# Altium schematic sheet Sheet1.SchDoc: Team Ether
size A2; SheetNumber: 1; SheetTotal: 1
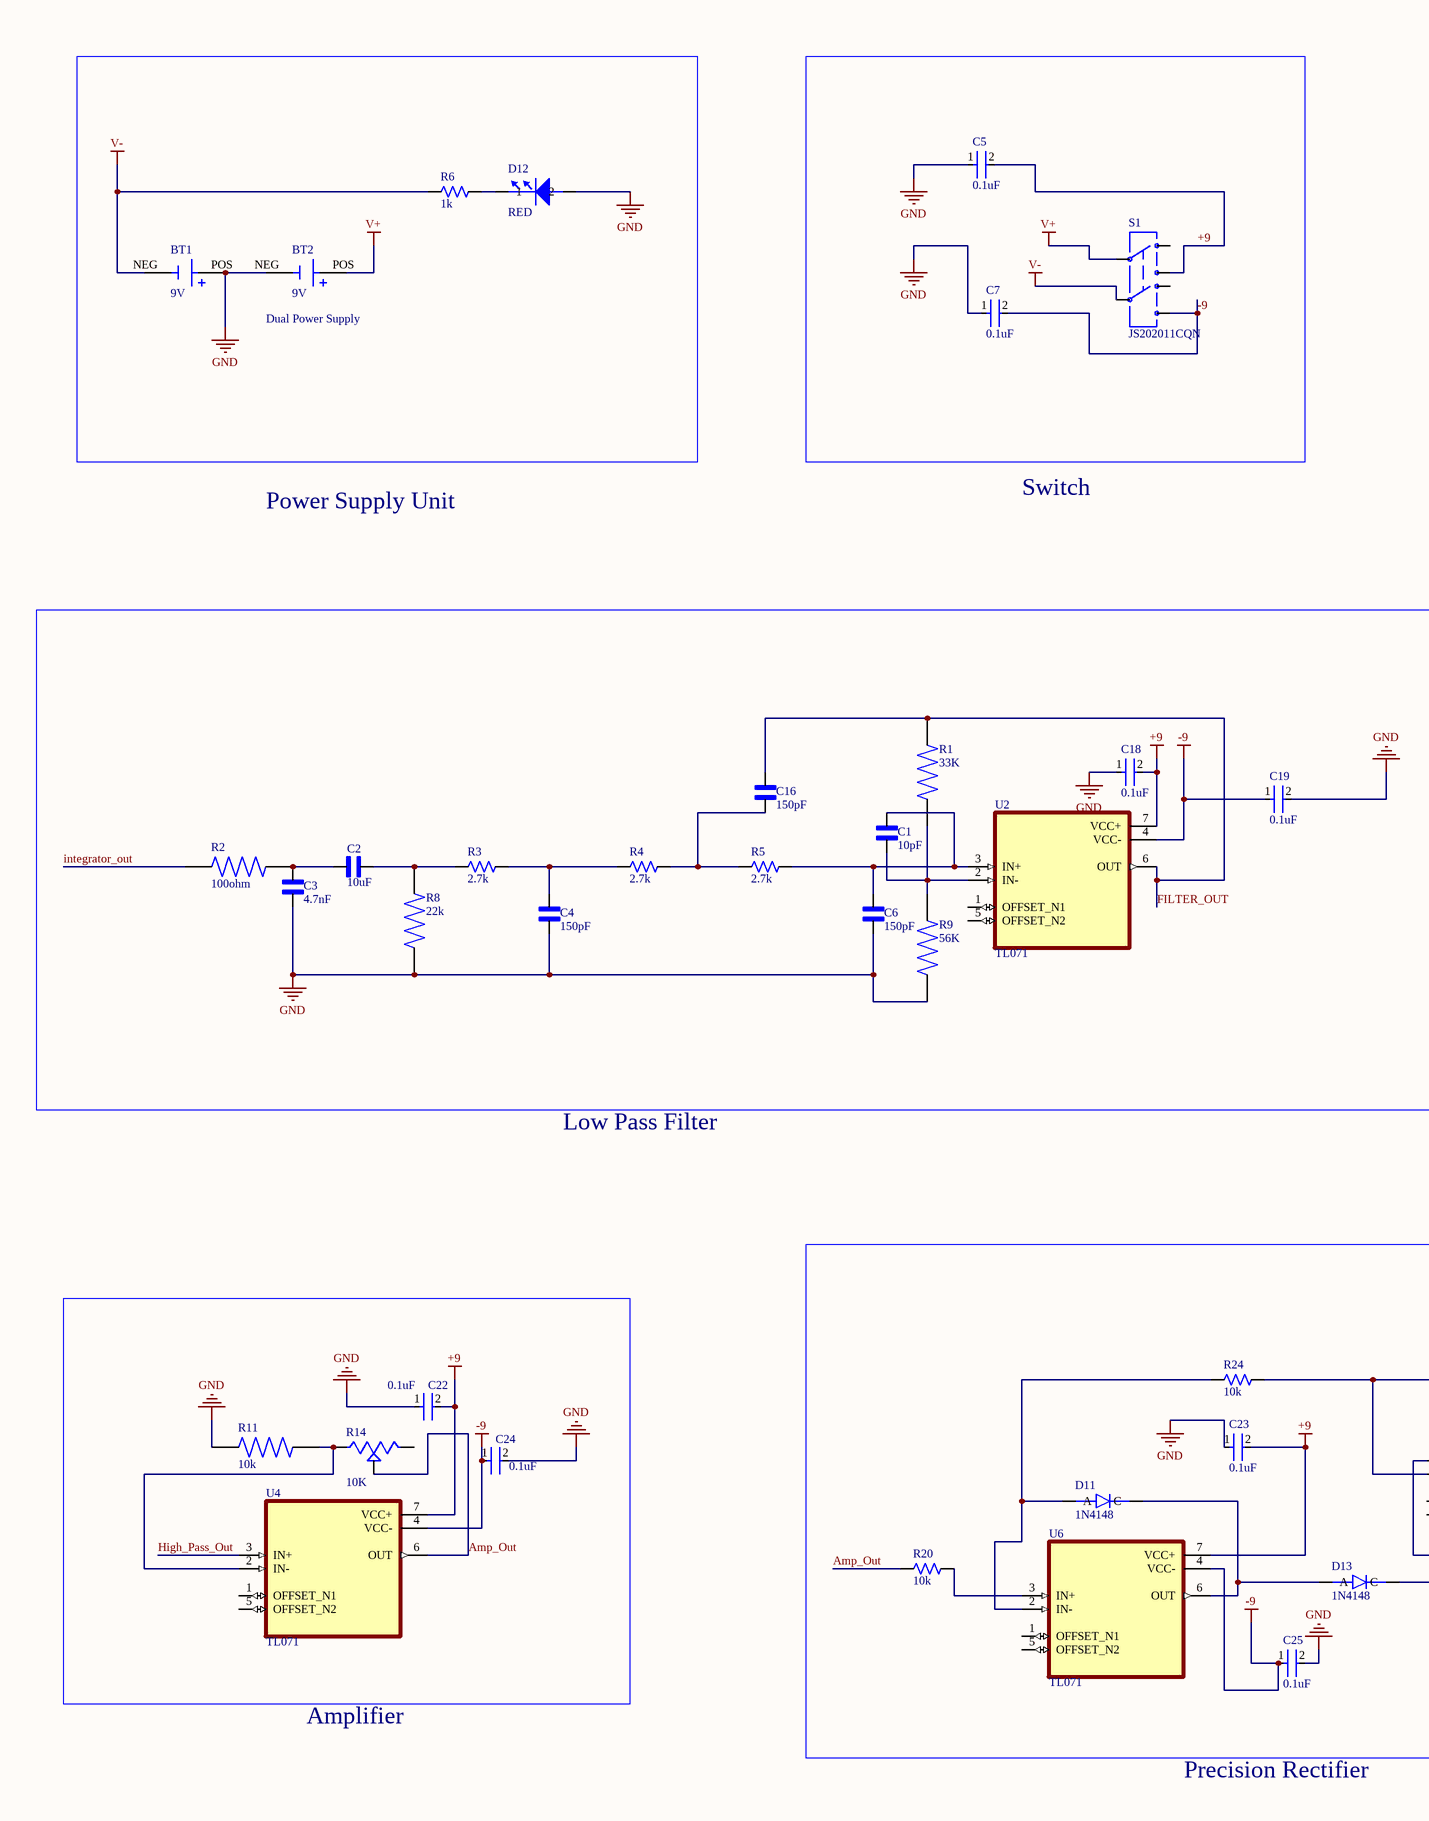
[diagram p0: Sheet1.SchDoc, left]
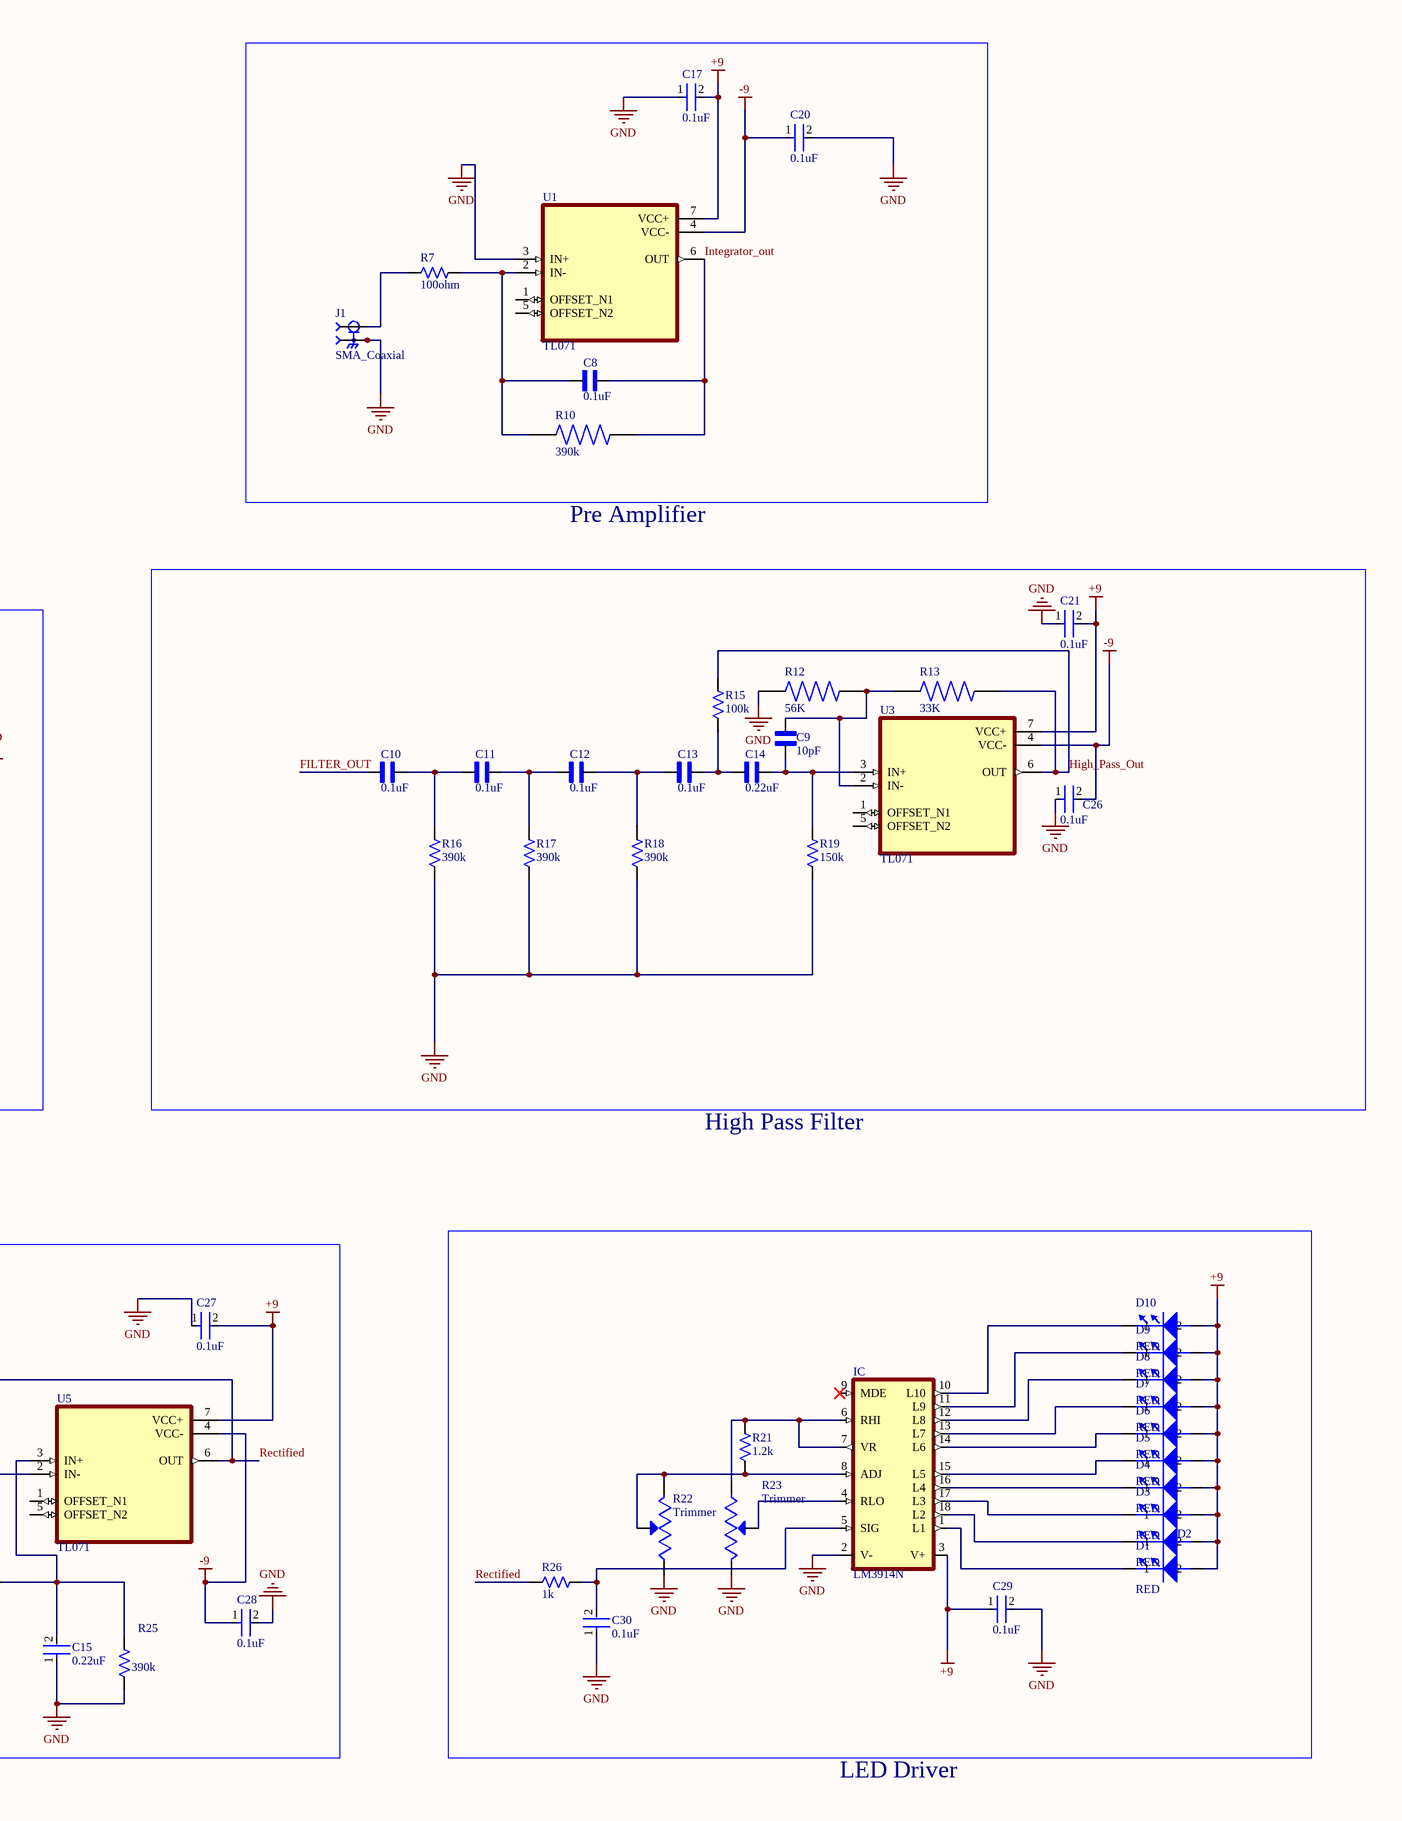
[diagram p1: Sheet1.SchDoc, right]

## Parts
BT1  9V  [BAT_BH9VW]
BT2  9V  [BAT_BH9VW]
C1  10pF  [CAPC1608X90N]
C2  10uF  [CAPC1608X90N]
C3  4.7nF  [CAPC1608X90N]
C4  150pF  [CAPC1608X90N]
C5  0.1uF  [FP-RDE2M1-MFG]
C6  150pF  [CAPC1608X90N]
C7  0.1uF  [FP-RDE2M1-MFG]
C8  0.1uF  [CAPC1005X55N]
C9  10pF  [CAPC1608X90N]
C10  0.1uF  [CAPC1005X55N]
C11  0.1uF  [CAPC1005X55N]
C12  0.1uF  [CAPC1005X55N]
C13  0.1uF  [CAPC1005X55N]
C14  0.22uF  [CAPC2012X135N]
C15  0.22uF  [FP-RDE2M1-MFG]
C16  150pF  [CAPC1608X90N]
C17  0.1uF  [FP-RDE2M1-MFG]
C18  0.1uF  [FP-RDE2M1-MFG]
C19  0.1uF  [FP-RDE2M1-MFG]
C20  0.1uF  [FP-RDE2M1-MFG]
C21  0.1uF  [FP-RDE2M1-MFG]
C22  0.1uF  [FP-RDE2M1-MFG]
C23  0.1uF  [FP-RDE2M1-MFG]
C24  0.1uF  [FP-RDE2M1-MFG]
C25  0.1uF  [FP-RDE2M1-MFG]
C26  0.1uF  [FP-RDE2M1-MFG]
C27  0.1uF  [FP-RDE2M1-MFG]
C28  0.1uF  [FP-RDE2M1-MFG]
C29  0.1uF  [FP-RDE2M1-MFG]
C30  0.1uF  [FP-RDE2M1-MFG]
D1  RED  [WL-TMRC_5MM]
D2  RED  [WL-TMRC_5MM]
D3  RED  [WL-TMRC_5MM]
D4  RED  [WL-TMRC_5MM]
D5  RED  [WL-TMRC_5MM]
D6  RED  [WL-TMRC_5MM]
D7  RED  [WL-TMRC_5MM]
D8  RED  [WL-TMRC_5MM]
D9  RED  [WL-TMRC_5MM]
D10  RED  [WL-TMRC_5MM]
D11  1N4148  [SOD2513X120N]
D12  RED  [WL-TMRC_5MM]
D13  1N4148  [SOD2513X120N]
IC  LM3914N  [DIL18]
J1  SMA_Coaxial  [SAMTEC_SMA-J-P-H-ST-EM1]
R1  33K  [RESC1608X55N]
R2  100ohm  [RESC2012X65N]
R3  2.7k  [BigRes]
R4  2.7k  [BigRes]
R5  2.7k  [BigRes]
R6  1k  [BigRes]
R7  100ohm  [BigRes]
R8  22k  [RESC2012X65N]
R9  56K  [RESC1608X55N]
R10  390k  [RESC2012X65N]
R11  10k  [RESC2012X65N]
R12  56K  [RESC1608X55N]
R13  33K  [RESC1608X55N]
R14  10K  [POT_PTN16-A05120K1B1]
R15  100k  [BigRes]
R16  390k  [BigRes]
R17  390k  [BigRes]
R18  390k  [BigRes]
R19  150k  [BigRes]
R20  10k  [BigRes]
R21  1.2k  [BigRes]
R22  Trimmer  [TRIM_3296W-1-505LF]
R23  Trimmer  [TRIM_3296W-1-505LF]
R24  10k  [BigRes]
R25  390k  [BigRes]
R26  1k  [BigRes]
S1  JS202011CQN  [SPARKFUN-RETIRED_SWITCH-2.5X3.2-6]
U1  TL071  [DIP794W45P254L959H508Q8]
U2  TL071  [DIP794W45P254L959H508Q8]
U3  TL071  [DIP794W45P254L959H508Q8]
U4  TL071  [DIP794W45P254L959H508Q8]
U5  TL071  [DIP794W45P254L959H508Q8]
U6  TL071  [DIP794W45P254L959H508Q8]

## Blocks framed on the sheet
Dual Power Supply: BT1 BT2 D12 R6

## Nets
+9: C5.2 C17.2 C18.2 C21.2 C22.2 C23.2 C27.2 C29.1 D1.2 D2.2 D3.2 D4.2 D5.2 D6.2 D7.2 D8.2 D9.2 D10.2 IC.3(V+) S1.3 U1.7(VCC+) U2.7(VCC+) U3.7(VCC+) U4.7(VCC+) U5.7(VCC+) U6.7(VCC+)
-9: C7.2 C19.1 C20.1 C24.1 C25.1 C26.2 C28.1 S1.6 U1.4(VCC-) U2.4(VCC-) U3.4(VCC-) U4.4(VCC-) U5.4(VCC-) U6.4(VCC-)
GND: BT1.POS BT2.NEG C3.1 C4.1 C5.1 C6.1 C7.1 C15.1 C17.1 C18.1 C19.2 C20.2 C21.1 C22.1 C23.1 C24.2 C25.2 C26.1 C27.1 C28.2 C29.2 C30.1 D12.2 IC.2(V-) J1.2_1 J1.2_2 J1.3_1 J1.3_2 R8.1 R9.1 R11.1 R12.2 R16.1 R17.1 R18.1 R19.1 R22.1(CCW) R23.3(CW) R25.1 U1.3(IN+)
V+: BT2.POS S1.2
V-: BT1.NEG R6.1 S1.5
Amp_Out: R14.2 R20.2 U4.6(OUT)
FILTER_OUT: C10.1 C16.2 R1.2 U2.6(OUT)
High_Pass_Out: R13.1 R15.2 U3.6(OUT) U4.3(IN+)
Integrator_out: C8.2 R2.1 R10.2 U1.6(OUT)
Rectified: R24.1 R26.2 U5.2(IN-) U5.6(OUT)
NetC1_1: C1.1 R1.1 R9.2 U2.2(IN-)
NetC1_2: C1.2 C6.2 R5.2 U2.3(IN+)
NetC2_1: C2.1 C3.2 R2.2
NetC2_2: C2.2 R3.1 R8.2
NetC4_2: C4.2 R3.2 R4.1
NetC8_1: C8.1 R7.2 R10.1 U1.2(IN-)
NetC9_1: C9.1 C14.2 R19.2 U3.3(IN+)
NetC9_2: C9.2 R12.1 R13.2 U3.2(IN-)
NetC10_2: C10.2 C11.1 R16.2
NetC11_2: C11.2 C12.1 R17.2
NetC12_2: C12.2 C13.1 R18.2
NetC13_2: C13.2 C14.1 R15.1
NetC15_2: C15.2 D13.C R25.2 U5.3(IN+)
NetC16_1: C16.1 R4.2 R5.1
NetC30_2: C30.2 IC.5(SIG) R26.1
NetD1_1: D1.1 IC.1(L1)
NetD2_1: D2.1 IC.18(L2)
NetD3_1: D3.1 IC.17(L3)
NetD4_1: D4.1 IC.16(L4)
NetD5_1: D5.1 IC.15(L5)
NetD6_1: D6.1 IC.14(L6)
NetD7_1: D7.1 IC.13(L7)
NetD8_1: D8.1 IC.12(L8)
NetD9_1: D9.1 IC.11(L9)
NetD10_1: D10.1 IC.10(L10)
NetD11_A: D11.A R24.2 U6.2(IN-)
NetD11_C: D11.C D13.A U6.6(OUT)
NetD12_1: D12.1 R6.2
NetIC_4: IC.4(RLO) R23.2(WIPER)
NetIC_6: IC.6(RHI) IC.7(VR) R21.2 R23.1(CCW)
NetIC_8: IC.8(ADJ) R21.1 R22.2(WIPER) R22.3(CW)
NetJ1_1: J1.1 R7.1
NetR11_2: R11.2 R14.1 U4.2(IN-)
NetR20_1: R20.1 U6.3(IN+)

Not connected (* = marked no-connect by the designer): IC 9(MDE)*; R14 3; S1 1 4; U1 1(OFFSET_N1) 5(OFFSET_N2); U2 1(OFFSET_N1) 5(OFFSET_N2); U3 1(OFFSET_N1) 5(OFFSET_N2); U4 1(OFFSET_N1) 5(OFFSET_N2); U5 1(OFFSET_N1) 5(OFFSET_N2); U6 1(OFFSET_N1) 5(OFFSET_N2)

## Notes on the sheet
- Power Supply Unit
- Switch
- Pre Amplifier
- Low Pass Filter
- High Pass Filter
- Amplifier
- Precision Rectifier
- LED Driver

## Library data of the parts
BT1 BT2 = BH9VW: Battery Holder _Open_ 9V 1 Cell Wire Leads - 6 _152.4mm_; MF: MPD; Value: *; Package: None; MP: BH9VW; Price: None; SnapEDA_Link: https://www.snapeda.com/parts/BH9VW/MPD/view-part/4480509/?ref=snap; Availability: Unavailable
C1 C9 = CL10C100JB8NNNC: 10 pF Â±5% 50V Ceramic Capacitor C0G, NP0 0603 (1608 Metric); MF: Samsung; SnapEDA_Link: https://www.snapeda.com/parts/CL10C100JB8NNNC/Samsung/view-part/?ref=snap; Package: SMD-2 Samsung; Value: *; MP: CL10C100JB8NNNC; Check_prices: https://www.snapeda.com/parts/CL10C100JB8NNNC/Samsung/view-part/?ref=eda
C2 = CL10A106MQ8NNNC: 10 ÂµF Â±20% 6.3V Ceramic Capacitor X5R 0603 (1608 Metric); MF: Samsung Electro-Mechanics; SnapEDA_Link: https://www.snapeda.com/parts/CL10A106MQ8NNNC/Samsung/view-part/?ref=snap; Package: SMD-2 Samsung; Value: *; MP: CL10A106MQ8NNNC; Check_prices: https://www.snapeda.com/parts/CL10A106MQ8NNNC/Samsung/view-part/?ref=eda
C3 = CL10B472KB8NNNC: Ceramic capacitor SMD 0603 4.7 nF 50 V 10 % Samsung Electro-Mechanics CL10B472KB8NNNC 4000 pc(s); SnapEDA_Link: https://www.snapeda.com/parts/CL10B472KB8NNNC/Samsung/view-part/?ref=snap; Package: SMD-2 Samsung; Value: *; MF: Samsung Electro-Mechanics; MP: CL10B472KB8NNNC; Check_prices: https://www.snapeda.com/parts/CL10B472KB8NNNC/Samsung/view-part/?ref=eda
C4 C6 C16 = CL10C151JB8NNNC: 150 pF Â±5% 50V Ceramic Capacitor C0G, NP0 0603 (1608 Metric); MF: Samsung Electro-Mechanics; SnapEDA_Link: https://www.snapeda.com/parts/CL10C151JB8NNNC/Samsung/view-part/?ref=snap; Package: SMD-2 Samsung; Value: *; MP: CL10C151JB8NNNC; Check_prices: https://www.snapeda.com/parts/CL10C151JB8NNNC/Samsung/view-part/?ref=eda
C5 C7 C15 C17-C30 = CMP-06035-041039-1: Ceramic Capacitor 100nF ±5% 50V C0G Radial
C8 C10-C13 = CL05B104KO5NNNC: 0.1 ÂµF Â±10% 16V Ceramic Capacitor X7R 0402 (1005 Metric); MF: Samsung; SnapEDA_Link: https://www.snapeda.com/parts/CL05B104KO5NNNC/Samsung/view-part/?ref=snap; Package: SMD-2 Samsung; Value: *; MP: CL05B104KO5NNNC; Check_prices: https://www.snapeda.com/parts/CL05B104KO5NNNC/Samsung/view-part/?ref=eda
C14 = CL21B224KBFNNNE: 0.22 ÂµF Â±10% 50V Ceramic Capacitor X7R 0805 (2012 Metric); MF: Samsung Electro-Mechanics; SnapEDA_Link: https://www.snapeda.com/parts/CL21B224KBFNNNE/Samsung/view-part/?ref=snap; Package: SMD-2 Samsung; Value: *; MP: CL21B224KBFNNNE; Check_prices: https://www.snapeda.com/parts/CL21B224KBFNNNE/Samsung/view-part/?ref=eda
D1-D10 D12 = SML-D12U1WT86: LED Uni-Color Red 2-Pin Chip 0603(1608Metric) T/R; Manufacturer: ROHM; Dominant Wavelength: 620nm; Forward Current: 20mA; Forward Voltage: 2.2V; Lens Color: White; Lens Transparency: Diffused; Luminous Flux: 1Zlm; Luminous Intensity: 63mcd; Number of Circuits: 1; Power Dissipation: 54mW; Reverse Voltage: 5V; Shape: Rectangular; Supplier: Arrow Electronics; Supplier Part Number: SML-D12U1WT86; Manufacturer Part Number: SML-D12U1WT86; RoHS: Compliant; Category: Optoelectronics; Stock: 11255; Pricing: 49=0.0757, 100=0.0539, 500=0.0424, 1000=0.0386, 3000=0.0317, 6000=0.0313 (USD); Case/Package: 1608; Case Code (Imperial): 0603; Case Code (Metric): 1608; Color: Red; Country of Origin: Japan, Mainland China, Malaysia; Export Control Classification Number (ECCN) Code: EAR99; Height: 550µm; Harmonized Tariff Schedule (HTS) Code: 8541.40.20.00; Introduction Date: 2016-04-18; Lead Free: Lead Free; Length: 1.6mm; Lifecycle Status: Production; Max Operating Temperature: 85°C; Min Operating Temperature: -40°C; Mounting Technology: Surface Mount; Number of Terminals: 2; REACH SVHC: Yes; Terminal Pitch: 1.65mm; Test Current: 20mA; Wavelength: 620nm; Width: 800µm; ComponentLink1URL: https://datasheet.octopart.com:443/SML-D12U1WT86-ROHM-datasheet-175953608.pdf?src-supplier=Future+Electronics; ComponentLink1Description: https://datasheet.octopart.com:443/SML-D12U1WT86-ROHM-datasheet-175953608.pdf?src-supplier=Future+Electronics; ComponentLink2URL: https://datasheet.octopart.com:443/SML-D12U1WT86-Rohm-datasheet-68298509.pdf?src-supplier=Future+Electronics; ComponentLink2Description: https://datasheet.octopart.com:443/SML-D12U1WT86-Rohm-datasheet-68298509.pdf?src-supplier=Future+Electronics; ComponentLink3URL: https://datasheet.octopart.com:443/SML-D12U1WT86-Rohm-datasheet-62059860.pdf?src-supplier=Future+Electronics; ComponentLink3Description: https://datasheet.octopart.com:443/SML-D12U1WT86-Rohm-datasheet-62059860.pdf?src-supplier=Future+Electronics; ComponentLink4URL: https://datasheet.octopart.com:443/SML-D12U1WT86-Rohm-datasheet-138791993.pdf?src-supplier=Upverter; ComponentLink4Description: https://datasheet.octopart.com:443/SML-D12U1WT86-Rohm-datasheet-138791993.pdf?src-supplier=Upverter; ComponentLink5URL: https://datasheet.octopart.com:443/SML-D12U1WT86-ROHM-datasheet-142144710.pdf?src-supplier=TME; ComponentLink5Description: https://datasheet.octopart.com:443/SML-D12U1WT86-ROHM-datasheet-142144710.pdf?src-supplier=TME; ComponentLink6URL: https://datasheet.octopart.com:443/SML-D12U1WT86-Rohm-datasheet-142144708.pdf?src-supplier=Rohm+SCT; ComponentLink6Description: https://datasheet.octopart.com:443/SML-D12U1WT86-Rohm-datasheet-142144708.pdf?src-supplier=Rohm+SCT
D11 D13 = 1N4148WS-7-F: Diode Switching 75V 0.3A 2-Pin SOD-323 | Diodes Inc 1N4148WS-7-F; MF: Diodes Inc.; SnapEDA_Link: https://www.snapeda.com/parts/1N4148WS-7-F/Diodes+Inc./view-part/?ref=snap; Package: SOD-323 Diodes Inc.; Value: *; MP: 1N4148WS-7-F; Check_prices: https://www.snapeda.com/parts/1N4148WS-7-F/Diodes+Inc./view-part/?ref=eda
IC = LM3914N: LED Lighting Drivers; MF: Texas Instruments; MP: LM3914N; Package: None; Price: None; Availability: Unavailable; Value: *; SnapEDA_Link: https://www.snapeda.com/parts/LM3914N/Texas%20Instruments/view-part/4652973/?ref=snap
J1 = SMA-J-P-H-ST-EM1: SMA Connector Jack, Female Socket 50 Ohms Board Edge, End Launch Solder; MF: Samtec; SnapEDA_Link: https://www.snapeda.com/parts/SMA-J-P-H-ST-EM1/Samtec+Inc./view-part/?ref=snap; Package: None; MP: SMA-J-P-H-ST-EM1; Check_prices: https://www.snapeda.com/parts/SMA-J-P-H-ST-EM1/Samtec+Inc./view-part/?ref=eda; Value: *
R1 R13 = 0603WAF3302T5E: 33K Ohm 1/10W Thick Film Resistor 0603 Chip - Surface Mount; MF: Uni-Royal; SnapEDA_Link: https://www.snapeda.com/parts/0603WAF3302T5E/Uni-Royal/view-part/?ref=snap; Package: 0603-2 ROYAL; Value: *; MP: 0603WAF3302T5E; Check_prices: https://www.snapeda.com/parts/0603WAF3302T5E/Uni-Royal/view-part/?ref=eda
R2 = 0805W8F1000T5E: 100 Ohm 1/8W Thick Film Resistor 0805 Chip - Surface Mount; MF: Uni-Royal; SnapEDA_Link: https://www.snapeda.com/parts/0805W8F1000T5E/Uni-Royal/view-part/?ref=snap; Package: 0805-2 ROYAL; Value: *; MP: 0805W8F1000T5E; Check_prices: https://www.snapeda.com/parts/0805W8F1000T5E/Uni-Royal/view-part/?ref=eda
R3-R7 R15-R21 R24-R26 = 10k: RES 4.3K OHM 1% 1/6W AXIAL; MF: YAGEO; MP: MFR-12FTF52-4K3; SnapEDA_Link: https://www.snapeda.com/parts/MFR-12FTF52-4K3/Yageo/view-part/?ref=snap; Package: RADIAL-2 Yageo; Value: *; Check_prices: https://www.snapeda.com/parts/MFR-12FTF52-4K3/Yageo/view-part/?ref=eda
R8 = 0805W8F2202T5E: 22K Ohm 1/8W Thick Film Resistor 0805 Chip - Surface Mount; MF: Uni-Royal; SnapEDA_Link: https://www.snapeda.com/parts/0805W8F2202T5E/Uni-Royal/view-part/?ref=snap; Package: 0805-2 ROYAL; Value: *; MP: 0805W8F2202T5E; Check_prices: https://www.snapeda.com/parts/0805W8F2202T5E/Uni-Royal/view-part/?ref=eda
R9 R12 = 0603WAF5602T5E: 56K Ohm 1/10W Thick Film Resistor 0603 Chip - Surface Mount; MF: Uni-Royal; SnapEDA_Link: https://www.snapeda.com/parts/0603WAF5602T5E/Uni-Royal/view-part/?ref=snap; Package: None; Value: *; MP: 0603WAF5602T5E; Check_prices: https://www.snapeda.com/parts/0603WAF5602T5E/Uni-Royal/view-part/?ref=eda
R10 = 0805W8F3903T5E: 390K Ohm 1/8W Thick Film Resistor 0805 Chip - Surface Mount; MF: Uni-Royal; SnapEDA_Link: https://www.snapeda.com/parts/0805W8F3903T5E/Uni-Royal/view-part/?ref=snap; Package: 0805-2 ROYAL; Value: *; MP: 0805W8F3903T5E; Check_prices: https://www.snapeda.com/parts/0805W8F3903T5E/Uni-Royal/view-part/?ref=eda
R11 = 0805W8F1002T5E: 10K Ohm 1/8W Thick Film Resistor 0805 Chip - Surface Mount; MF: Uni-Royal; SnapEDA_Link: https://www.snapeda.com/parts/0805W8F1002T5E/Uni-Royal/view-part/?ref=snap; Package: 0805-2 ROYAL; Value: *; MP: 0805W8F1002T5E; Check_prices: https://www.snapeda.com/parts/0805W8F1002T5E/Uni-Royal/view-part/?ref=eda
R14 = PTN16-A05120K1B1: 16.5 mm, Horizontal, Linear, 5 kÎ©, Through Hole, Knurled Shaft Single Section Rotary Potentiometer; MF: Same Sky; SnapEDA_Link: https://www.snapeda.com/parts/PTN16-A05120K1B1/Same+Sky/view-part/?ref=snap; Package: Package; Value: *; MP: PTN16-A05120K1B1; Check_prices: https://www.snapeda.com/parts/PTN16-A05120K1B1/Same+Sky/view-part/?ref=eda
R22 R23 = 3296W-1-505LF: TRIMMER,CERMET,REST 5M OHMS,PCB,25 TURNS,PWR-RTG 0.5W | Bourns 3296W-1-505LF; SnapEDA_Link: https://www.snapeda.com/parts/3296W-1-505LF/Bourns/view-part/?ref=snap; Package: NON STANDARD-3 Bourns; Value: *; MF: Bourns; MP: 3296W-1-505LF; Check_prices: https://www.snapeda.com/parts/3296W-1-505LF/Bourns/view-part/?ref=eda
S1 = JS202011CQN: Switch, Slide, DPDT, ON-ON, Top Slide, 300mA, 6VDC, ThruHole, PC Pin | C&K JS202011CQN; SnapEDA_Link: https://www.snapeda.com/parts/JS202011CQN/C%2526K/view-part/?ref=snap; Package: None; Value: *; MF: C&K; MP: JS202011CQN; Check_prices: https://www.snapeda.com/parts/JS202011CQN/C%2526K/view-part/?ref=eda
U1-U6 = TL071CP: Single, 30-V, 3-MHz, high slew rate (13-V/Âµs), In to V+, JFET-input op amp; MF: Texas Instruments; SnapEDA_Link: https://www.snapeda.com/parts/TL071CP/Texas+Instruments/view-part/?ref=snap; Package: PDIP-8 Texas; Value: *; MP: TL071CP; Check_prices: https://www.snapeda.com/parts/TL071CP/Texas+Instruments/view-part/?ref=eda